# Altium schematic sheet Sheet3.SchDoc
size A3; SheetNumber: 3; SheetTotal: 4
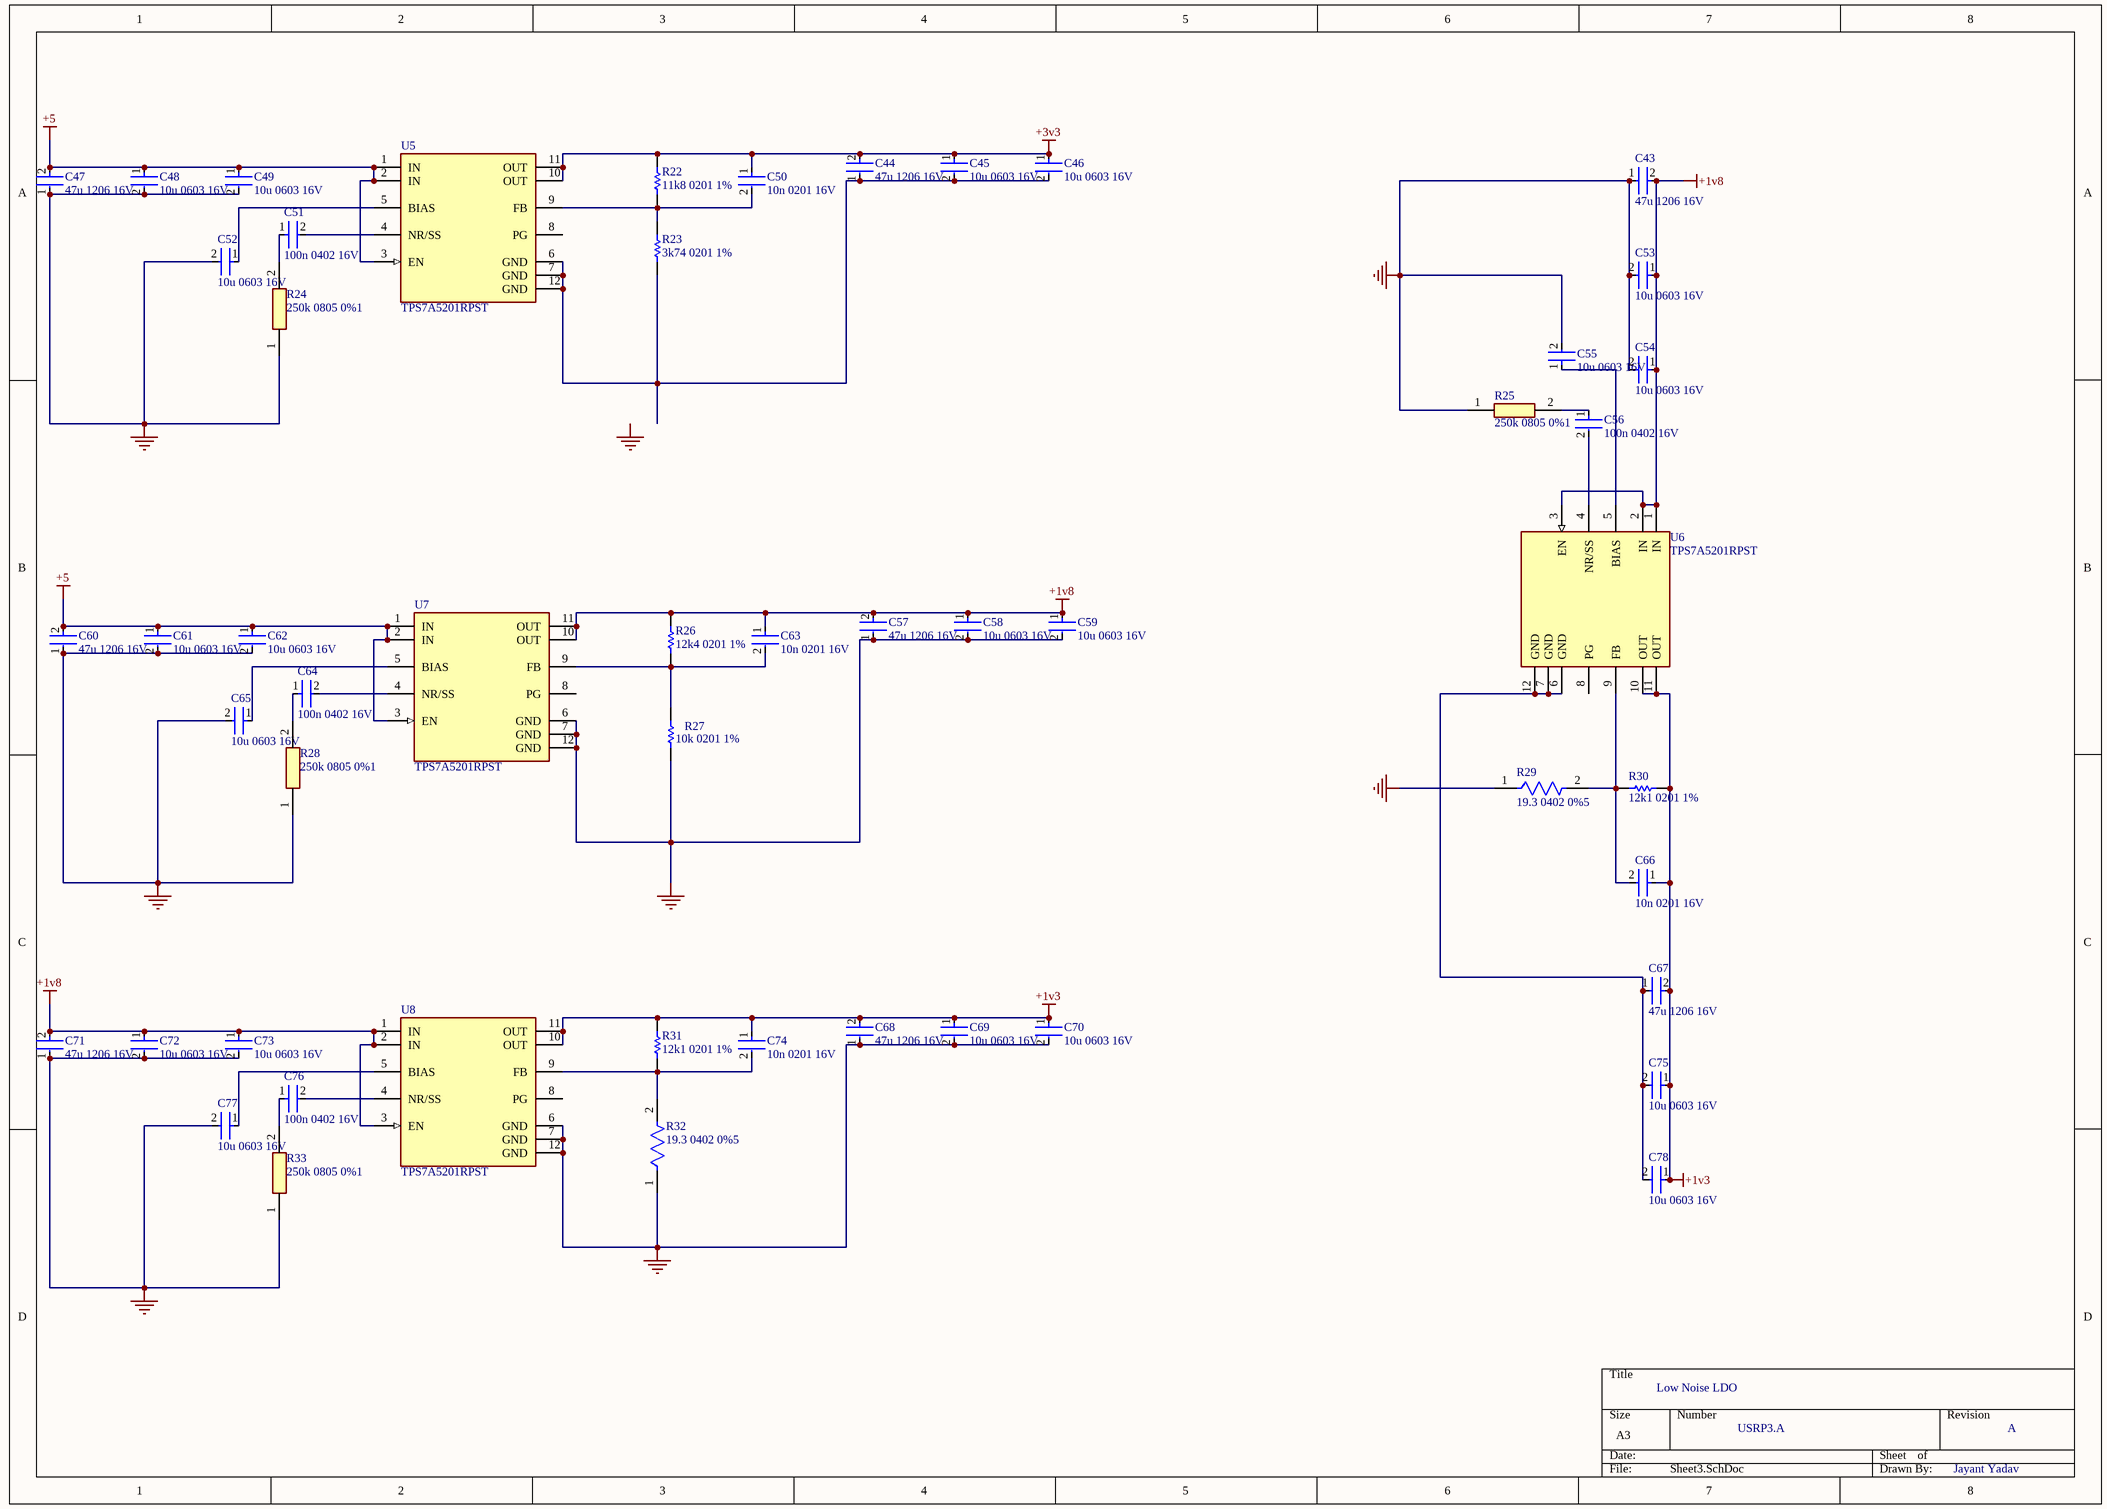
[diagram p0: Sheet3.SchDoc]

## Parts
C43  47u 1206 16V  [FP-GRM31C-0_3-e0_3_0_8-IPC_C]
C44  47u 1206 16V  [FP-GRM31C-0_3-e0_3_0_8-IPC_C]
C45  10u 0603 16V  [FP-CC0603-DC-MFG]
C46  10u 0603 16V  [FP-CC0603-DC-MFG]
C47  47u 1206 16V  [FP-GRM31C-0_3-e0_3_0_8-IPC_C]
C48  10u 0603 16V  [FP-CC0603-DC-MFG]
C49  10u 0603 16V  [FP-CC0603-DC-MFG]
C50  10n 0201 16V  [FP-CC0201-BA-MFG]
C51  100n 0402 16V  [FP-C0402-BB-MFG]
C52  10u 0603 16V  [FP-CC0603-DC-MFG]
C53  10u 0603 16V  [FP-CC0603-DC-MFG]
C54  10u 0603 16V  [FP-CC0603-DC-MFG]
C55  10u 0603 16V  [FP-CC0603-DC-MFG]
C56  100n 0402 16V  [FP-C0402-BB-MFG]
C57  47u 1206 16V  [FP-GRM31C-0_3-e0_3_0_8-IPC_C]
C58  10u 0603 16V  [FP-CC0603-DC-MFG]
C59  10u 0603 16V  [FP-CC0603-DC-MFG]
C60  47u 1206 16V  [FP-GRM31C-0_3-e0_3_0_8-IPC_C]
C61  10u 0603 16V  [FP-CC0603-DC-MFG]
C62  10u 0603 16V  [FP-CC0603-DC-MFG]
C63  10n 0201 16V  [FP-CC0201-BA-MFG]
C64  100n 0402 16V  [FP-C0402-BB-MFG]
C65  10u 0603 16V  [FP-CC0603-DC-MFG]
C66  10n 0201 16V  [FP-CC0201-BA-MFG]
C67  47u 1206 16V  [FP-GRM31C-0_3-e0_3_0_8-IPC_C]
C68  47u 1206 16V  [FP-GRM31C-0_3-e0_3_0_8-IPC_C]
C69  10u 0603 16V  [FP-CC0603-DC-MFG]
C70  10u 0603 16V  [FP-CC0603-DC-MFG]
C71  47u 1206 16V  [FP-GRM31C-0_3-e0_3_0_8-IPC_C]
C72  10u 0603 16V  [FP-CC0603-DC-MFG]
C73  10u 0603 16V  [FP-CC0603-DC-MFG]
C74  10n 0201 16V  [FP-CC0201-BA-MFG]
C75  10u 0603 16V  [FP-CC0603-DC-MFG]
C76  100n 0402 16V  [FP-C0402-BB-MFG]
C77  10u 0603 16V  [FP-CC0603-DC-MFG]
C78  10u 0603 16V  [FP-CC0603-DC-MFG]
R22  11k8 0201 1%  [RESC0603X28X15LL05T05]
R23  3k74 0201 1%  [RESC0603X28X15LL05T05]
R24  250k 0805 0%1  [RESC2012X65N]
R25  250k 0805 0%1  [RESC2012X65N]
R26  12k4 0201 1%  [RESC0603X26X15NL03T05]
R27  10k 0201 1%  [RESC0603X28X15LL05T05]
R28  250k 0805 0%1  [RESC2012X65N]
R29  19.3 0402 0%5  [FP-RN73R1E-IPC_B]
R30  12k1 0201 1%  [RESC0603X26X15NL03T05]
R31  12k1 0201 1%  [RESC0603X26X15NL03T05]
R32  19.3 0402 0%5  [FP-RN73R1E-IPC_B]
R33  250k 0805 0%1  [RESC2012X65N]
U5  TPS7A5201RPST  [FP-RPS0012A-MFG]
U6  TPS7A5201RPST  [FP-RPS0012A-MFG]
U7  TPS7A5201RPST  [FP-RPS0012A-MFG]
U8  TPS7A5201RPST  [FP-RPS0012A-MFG]

## Nets
+1v3: C66.1 C67.2 C68.2 C69.1 C70.1 C74.1 C75.1 C78.1 R30.2 R31.2 U6.10(OUT) U6.11(OUT) U8.10(OUT) U8.11(OUT)
+1v8: C43.2 C53.1 C54.1 C57.2 C58.1 C59.1 C63.1 C71.2 C72.1 C73.1 R26.2 U6.1(IN) U6.2(IN) U6.3(EN) U7.10(OUT) U7.11(OUT) U8.1(IN) U8.2(IN) U8.3(EN)
+3v3: C44.2 C45.1 C46.1 C50.1 R22.2 U5.10(OUT) U5.11(OUT)
+5: C47.2 C48.1 C49.1 C60.2 C61.1 C62.1 U5.1(IN) U5.2(IN) U5.3(EN) U7.1(IN) U7.2(IN) U7.3(EN)
GND: C43.1 C47.1 C48.2 C49.2 C52.2 C53.2 C54.2 C55.2 C57.1 C58.2 C59.2 C60.1 C61.2 C62.2 C65.2 C68.1 C69.2 C70.2 C71.1 C72.2 C73.2 C77.2 R24.1 R25.1 R27.1 R28.1 R29.1 R32.1 R33.1 U7.6(GND) U7.7(GND) U7.12(GND) U8.6(GND) U8.7(GND) U8.12(GND)
NetC44_1: C44.1 C45.2 C46.2 R23.1 U5.6(GND) U5.7(GND) U5.12(GND)
NetC50_2: C50.2 R22.1 R23.2 U5.9(FB)
NetC51_1: C51.1 R24.2
NetC51_2: C51.2 U5.4(NR/SS)
NetC52_1: C52.1 U5.5(BIAS)
NetC55_1: C55.1 U6.5(BIAS)
NetC56_1: C56.1 R25.2
NetC56_2: C56.2 U6.4(NR/SS)
NetC63_2: C63.2 R26.1 R27.2 U7.9(FB)
NetC64_1: C64.1 R28.2
NetC64_2: C64.2 U7.4(NR/SS)
NetC65_1: C65.1 U7.5(BIAS)
NetC66_2: C66.2 R29.2 R30.1 U6.9(FB)
NetC67_1: C67.1 C75.2 C78.2 U6.6(GND) U6.7(GND) U6.12(GND)
NetC74_2: C74.2 R31.1 R32.2 U8.9(FB)
NetC76_1: C76.1 R33.2
NetC76_2: C76.2 U8.4(NR/SS)
NetC77_1: C77.1 U8.5(BIAS)

Not connected (* = marked no-connect by the designer): U5 8(PG); U6 8(PG); U7 8(PG); U8 8(PG)

## Notes on the sheet
- Low Noise LDO
- USRP3.A
- A
- Jayant Yadav
- Labels drawn without touching a wire or pin: GND

## Library data of the parts
C43 C44 C47 C57 C60 C67 C68 C71 = CMP-06035-011430-1: Chip Multilayer Ceramic Capacitors for General Purpose, 1206, 47uF, X5R, 15%, 20%, 16V; Capacitance: 47uF; Length: 3.2mm; Thickness: 1.6mm; Width: 1.6mm; Voltage Rating (DC): 16V; Tolerance: 20%; Dielectric: X5R
C45 C46 C48 C49 C52-C55 C58 C59 C61 C62 C65 C69 C70 C72 C73 C75 C77 C78 = CMP-00621-81932632-1: CC0603KRX5R7BB106 Multilayer Ceramic Capacitor, 10 uF, 16 V, ± 10%, X5R, 0603 [1608 Metric]; Capacitance: 10µF; NexarPartId: 81932632; Height: 1mm; Halogen Free: Halogen Free; Voltage Rating: 16V; Dielectric: X5R; Max Operating Temperature: 85°C; Voltage Rating (DC): 16V; Material: Ceramic; Lead Free: Lead Free; Tolerance: 10%; RoHS: Non-Compliant; Min Operating Temperature: -55°C; Case/Package: 0603
C50 C63 C66 C74 = CMP-03422-000237-1: CAP CER 10000PF 16V X7R 0201; Manufacturer: Yageo; Manufacturer Part Number: CC0201KRX7R7BB103; Value: 10 nF; Material: Ceramic; Tolerance: 0.1; Temperature Coefficient: 15%; Ipc Land Pattern Name: CAPC6030X30; Footprint Url: http://www.yageo.com/exep/pages/download/literatures/UPY-C_GEN_24.pdf; Device Class L2: Capacitors; Mouser Description: Multilayer Ceramic Capacitors MLCC - SMD/SMT 10nF 16V X7R 10%; Octopart: https://octopart.com/cc0201krx7r7bb103-yageo-9292627; Temperature: -55°C to +85°C; Package: CC0201-BA; Capacitance: 10 nF; Device Class L1: Passive Components; Device Class L3: Ceramic Capacitors; Digikey Description: CAP CER 10000PF 16V X7R 0201; ComponentLink2URL: http://www.yageo.com/documents/recent/UPY-GPHC_X5R_4V-to-50V_25.pdf; Temperature Characteristic: X7R; Automotive: No; RoHS: TRUE; Voltage Rating: 16 V; Temperature Range Low: -55°C; Category: Cap; Height: 0.33mm; ComponentLink2Description: Datasheet; Temperature Range High: +85°C; Lead Free: Yes
C51 C56 C64 C76 = CMP-2008-03082-2: CAP CER 0.1UF 16V X7R 0402; Manufacturer Part Number: C0402C104K4RACAUTO; Manufacturer: Kemet; Temperature Coefficient: 15%; Tolerance: 0.1; Capacitance: 0.10 μF; Material: Ceramic; Value: 0.10 μF; Device Class L3: Ceramic Capacitors; Voltage Rating: 16 V; Temperature Range High: +125°C; Device Class L2: Capacitors; Height: 0.55mm; Category: Cap; RoHS: TRUE; Temperature Characteristic: X7R; Octopart: https://octopart.com/c0402c104k4racauto-kemet-17309149; Digikey Description: CAP CER 0.1UF 16V X7R 0402; Device Class L1: Passive Components; Temperature Range Low: -55°C; Mouser Description: Cap Ceramic 0.1uF 16V X7R 10% Pad SMD 0402 125C Automotive T/R; ComponentLink2Description: Datasheet; Automotive: No; Ipc Land Pattern Name: CAPC10050X50; ComponentLink2URL: https://content.kemet.com/datasheets/KEM_C1002_X7R_SMD.pdf; Lead Free: Yes; Temperature: -55°C to +125°C; Package: C0402-BB
R22 = CMP-2004-00049-1: Manufacturer: Vishay Dale; Part Number: CRCW020111K8FNED
R23 = CMP-2004-00570-1: Part Number: CRCW02013K74FNED; Manufacturer: Vishay Dale
R24 R25 R28 R33 = RNCF0805BTE250K: Resistor; Manufacturer_Name: Stackpole Electronics; Datasheet Link: https://www.seielect.com/catalog/sei-rncf.pdf; Height: 0.65mm; Manufacturer_Part_Number: RNCF0805BTE250K; Arrow Part Number: RNCF0805BTE250K; Arrow Price/Stock: https://www.arrow.com/en/products/rncf0805bte250k/stackpole-electronics?utm_currency=USD&region=nac
R26 = CMP-2004-03223-1: Manufacturer: Panasonic; Part Number: ERJ-1GNF1242C
R27 = CMP-2004-00016-1: Manufacturer: Vishay Dale; Part Number: CRCW020110K0FNED
R29 R32 = CMP-04015-035147-1: 19.3kΩ ±0.1% 0.063W, 1/16W Chip Resistor 0402 (1005 Metric) Moisture Resistant Thin Film
R30 R31 = CMP-1010-00538-2: Part Number: ERJ-1GNF1212C; Manufacturer: Panasonic
U5-U8 = CMP-04917-000343-1: IC REG LINEAR POS ADJ 2A 12VQFN